# Altium schematic sheet 01_INPUT_POWER.SchDoc
size A3
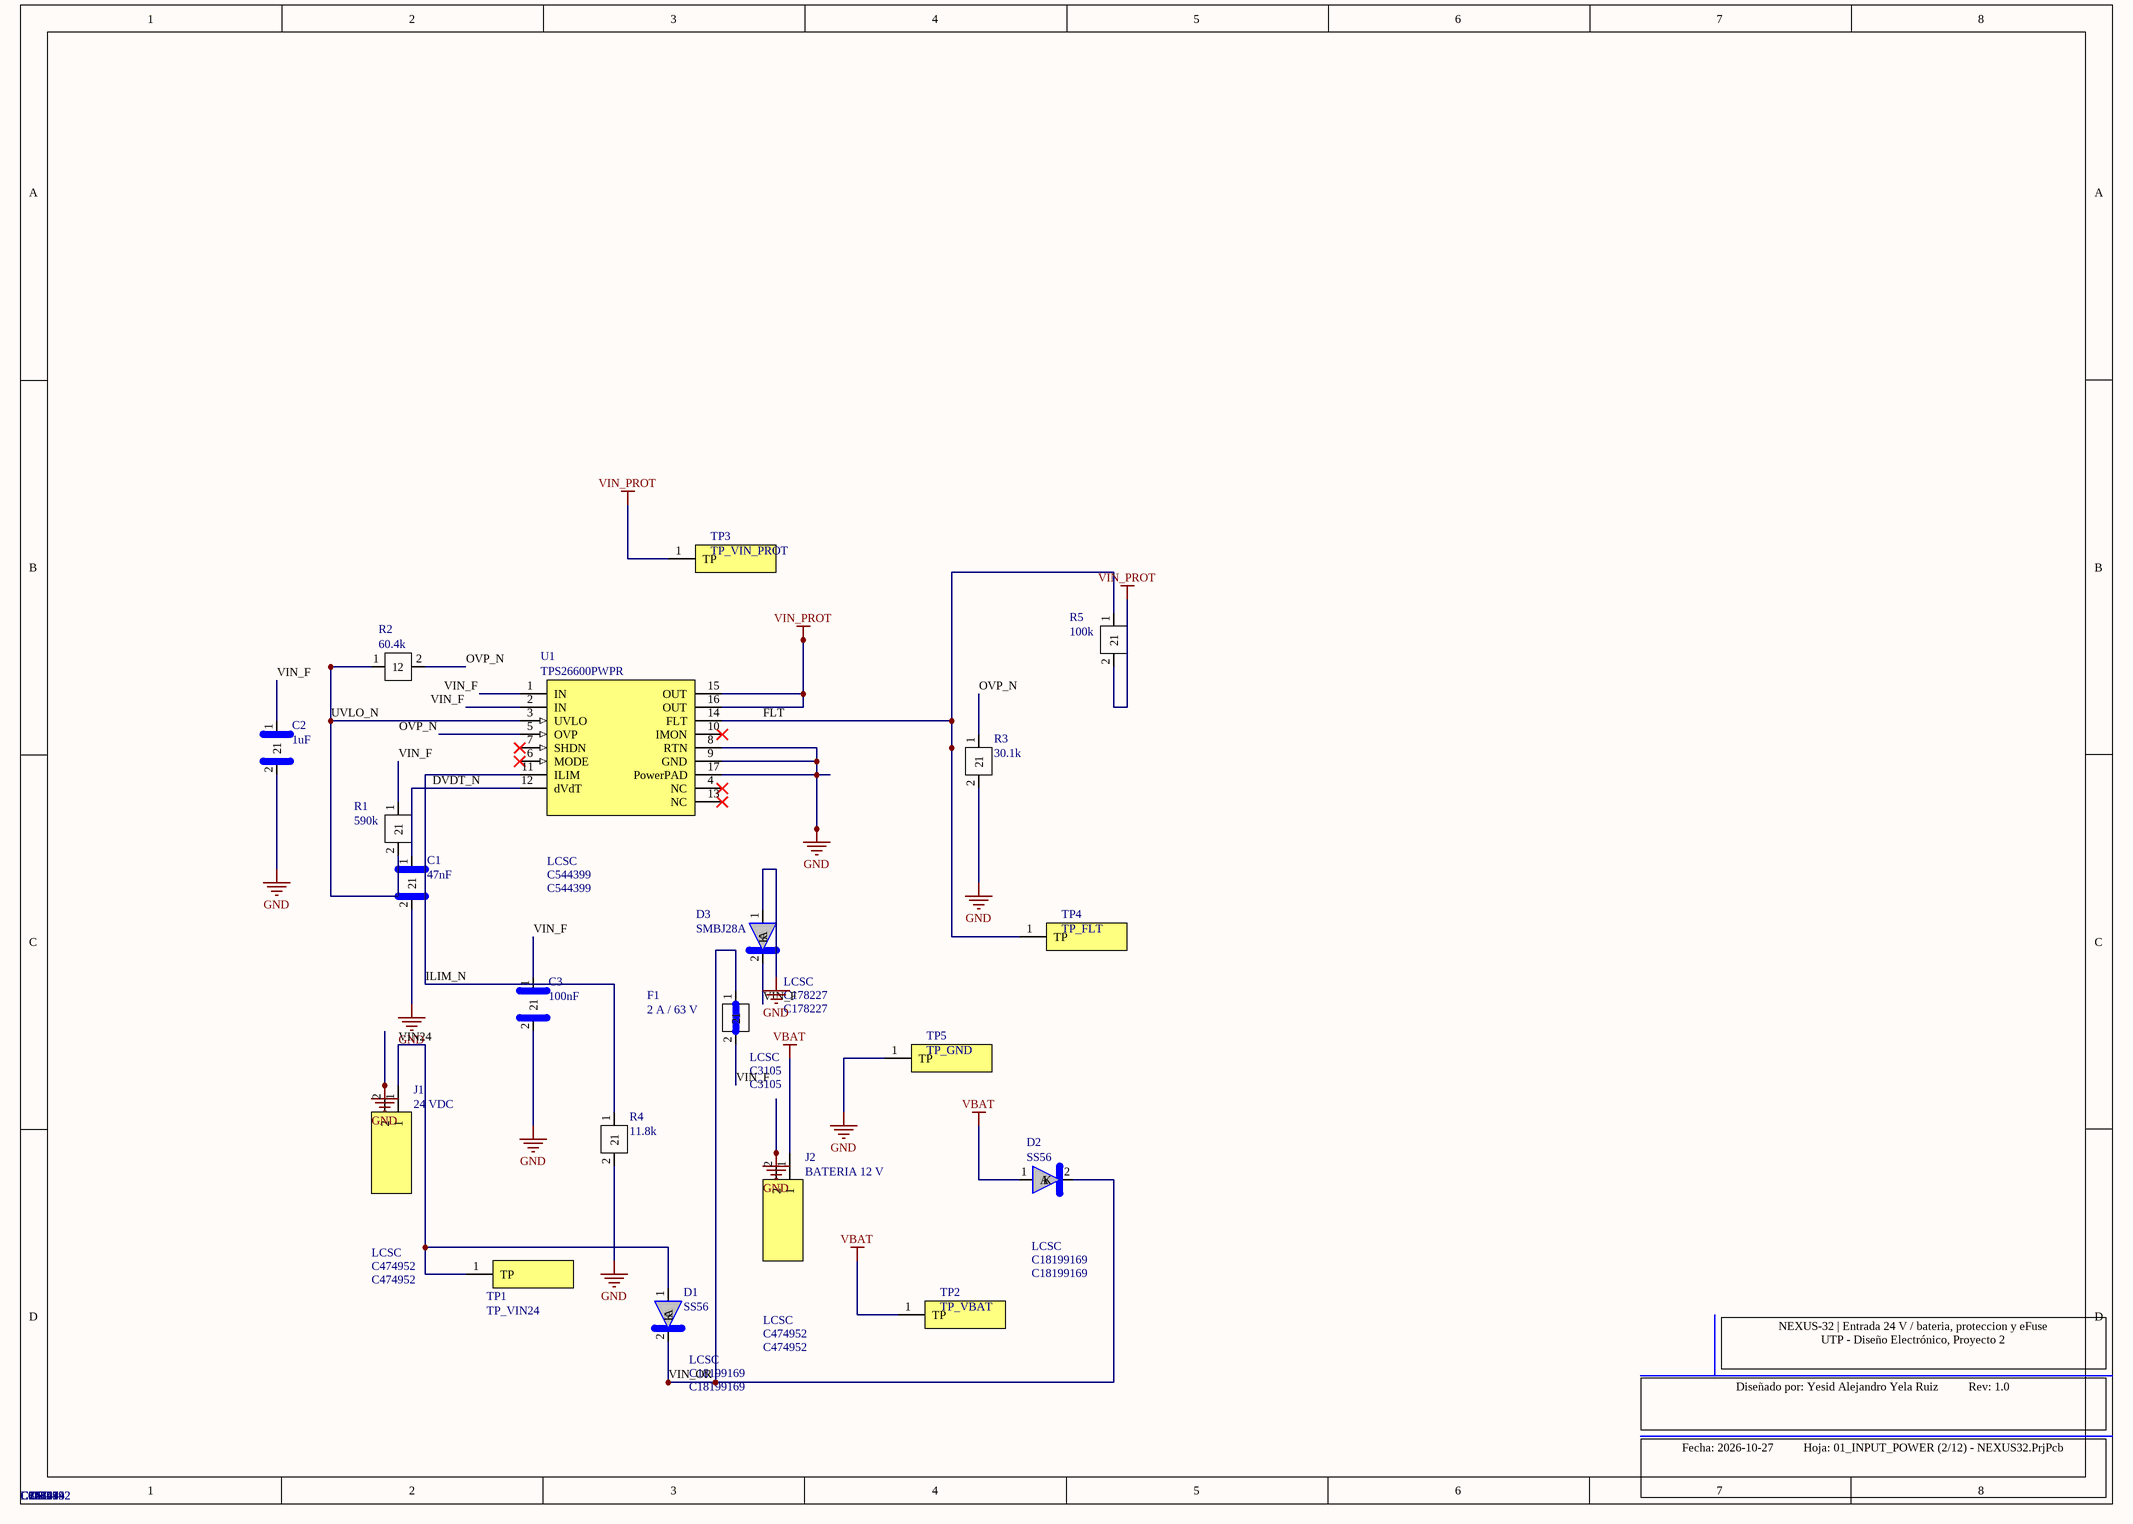
[diagram p0: 01_INPUT_POWER.SchDoc]

## Parts
C1  47nF  Supplier 1: LCSC  Supplier Part Number 1: C1622  [R_0603]
C2  1uF  Supplier 1: LCSC  Supplier Part Number 1: C15849  [R_0603]
C3  100nF  Supplier 1: LCSC  Supplier Part Number 1: C14663  [R_0603]
D1  SS56  Supplier 1: LCSC  Supplier Part Number 1: C18199169  [D_SMA]
D2  SS56  Supplier 1: LCSC  Supplier Part Number 1: C18199169  [D_SMA]
D3  SMBJ28A  Supplier 1: LCSC  Supplier Part Number 1: C178227  [D_SMB]
F1  2 A / 63 V  Supplier 1: LCSC  Supplier Part Number 1: C3105  [F_1206]
J1  24 VDC  Supplier 1: LCSC  Supplier Part Number 1: C474952  [TB_KF128-5.08-2P]
J2  BATERIA 12 V  Supplier 1: LCSC  Supplier Part Number 1: C474952  [TB_KF128-5.08-2P]
R1  590k  Supplier 1: LCSC  Supplier Part Number 1: C861479  [R_0603]
R2  60.4k  Supplier 1: LCSC  Supplier Part Number 1: C862235  [R_0603]
R3  30.1k  Supplier 1: LCSC  Supplier Part Number 1: C2989442  [R_0603]
R4  11.8k  Supplier 1: LCSC  Supplier Part Number 1: C22861  [R_0603]
R5  100k  Supplier 1: LCSC  Supplier Part Number 1: C25803  [R_0603]
TP1  TP_VIN24  [TP_PAD_1.5mm]
TP2  TP_VBAT  [TP_PAD_1.5mm]
TP3  TP_VIN_PROT  [TP_PAD_1.5mm]
TP4  TP_FLT  [TP_PAD_1.5mm]
TP5  TP_GND  [TP_PAD_1.5mm]
U1  TPS26600PWPR  Supplier 1: LCSC  Supplier Part Number 1: C544399  [HTSSOP-16-EP_PWP_P0.65]

## Nets
GND: C1.2 C2.2 C3.2 D3.1(A) J1.2 J2.2 R3.2 R4.2 TP5.1(TP) U1.8(RTN) U1.9(GND) U1.17(PowerPAD)
VBAT: D2.1(A) J2.1 TP2.1(TP)
VIN_PROT: R5.2 TP3.1(TP) U1.15(OUT) U1.16(OUT)
DVDT_N: C1.1 U1.12(dVdT)
FLT: R5.1 TP4.1(TP) U1.14(FLT)
ILIM_N: R4.1 U1.11(ILIM)
OVP_N: R2.2 R3.1 U1.5(OVP)
UVLO_N: R1.2 R2.1 U1.3(UVLO)
VIN24: D1.1(A) J1.1 TP1.1(TP)
VIN_F: C2.1 C3.1 D3.2(K) F1.2 R1.1 U1.1(IN) U1.2(IN)
VIN_OR: D1.2(K) D2.2(K) F1.1

Not connected (* = marked no-connect by the designer): U1 4(NC)* 6(MODE)* 7(SHDN)* 10(IMON)* 13(NC)*

## Notes on the sheet
- NEXUS-32 | Entrada 24 V / bateria, proteccion y eFuse
  UTP - Diseño Electrónico, Proyecto 2
- Diseñado por: Yesid Alejandro Yela Ruiz          Rev: 1.0
- Fecha: 2026-10-27          Hoja: 01_INPUT_POWER (2/12) - NEXUS32.PrjPcb

## Library data of the parts
C1 = CAP_0603: Condensador ceramico SMD 0603; Manufacturer: Samsung; Manufacturer Part Number: CL10B473KB8NNNC; Datasheet: https://wmsc.lcsc.com/wmsc/upload/file/pdf/v2/lcsc/2206010045_UNI-ROYAL-Uniroyal-Elec-0603WAF1002T5E_C25804.pdf; LCSC Part #: C1622
C2 = CAP_0603: Condensador ceramico SMD 0603; Manufacturer: Samsung; Manufacturer Part Number: CL10A105KB8NNNC; Datasheet: https://wmsc.lcsc.com/wmsc/upload/file/pdf/v2/lcsc/2206010045_UNI-ROYAL-Uniroyal-Elec-0603WAF1002T5E_C25804.pdf; LCSC Part #: C15849
C3 = CAP_0603: Condensador ceramico SMD 0603; Manufacturer: YAGEO; Manufacturer Part Number: CC0603KRX7R9BB104; Datasheet: https://wmsc.lcsc.com/wmsc/upload/file/pdf/v2/lcsc/2206010045_UNI-ROYAL-Uniroyal-Elec-0603WAF1002T5E_C25804.pdf; LCSC Part #: C14663
D1 D2 = SS56: Diodo Schottky 40V 5A SMA (MDD SS54); Manufacturer: hongjiacheng; Manufacturer Part Number: SS56; LCSC Part #: C18199169; Datasheet: https://wmsc.lcsc.com/wmsc/upload/file/pdf/v2/lcsc/2407101107_MDD-Microdiode-Semiconductor-SS54_C22452.pdf
D3 = SMBJ28A: TVS unidireccional 28V 600W SMB (Littelfuse SMBJ28A); Manufacturer: Littelfuse; Manufacturer Part Number: SMBJ28A; LCSC Part #: C178227; Datasheet: https://wmsc.lcsc.com/wmsc/upload/file/pdf/v2/lcsc/2304140030_Littelfuse-SMBJ28A_C178227.pdf
F1 = FUSE_1206: Fusible SMD 1206 2A 63V (Littelfuse 0466002.NRHF); Manufacturer: Littelfuse; Manufacturer Part Number: 0466002.NRHF; LCSC Part #: C3105; Datasheet: https://wmsc.lcsc.com/wmsc/upload/file/pdf/v2/lcsc/1810111920_Littelfuse-0466002-NRHF_C3105.pdf
J1 J2 = KF128-5.08-2P-AA: Bornera tornillo 2 polos paso 5.08mm (Cixi Kefa KF128-5.08-2P-AA); Manufacturer: Cixi Kefa Electronics (KEFA); Manufacturer Part Number: KF128-5.08-2P-AA; LCSC Part #: C474952; Datasheet: https://wmsc.lcsc.com/wmsc/upload/file/pdf/v2/lcsc/2408211511_Cixi-Kefa-Elec-KF128-5-08-2P-AA_C474952.pdf
R1 = RES_0603: Resistencia SMD 0603; Manufacturer: YAGEO; Manufacturer Part Number: RT0603BRD07590KL; Datasheet: https://wmsc.lcsc.com/wmsc/upload/file/pdf/v2/lcsc/2206010045_UNI-ROYAL-Uniroyal-Elec-0603WAF1002T5E_C25804.pdf; LCSC Part #: C861479
R2 = RES_0603: Resistencia SMD 0603; Manufacturer: YAGEO; Manufacturer Part Number: RT0603BRE0760K4L; Datasheet: https://wmsc.lcsc.com/wmsc/upload/file/pdf/v2/lcsc/2206010045_UNI-ROYAL-Uniroyal-Elec-0603WAF1002T5E_C25804.pdf; LCSC Part #: C862235
R3 = RES_0603: Resistencia SMD 0603; Manufacturer: UNI-ROYAL; Manufacturer Part Number: TC0325B3012T5F; Datasheet: https://wmsc.lcsc.com/wmsc/upload/file/pdf/v2/lcsc/2206010045_UNI-ROYAL-Uniroyal-Elec-0603WAF1002T5E_C25804.pdf; LCSC Part #: C2989442
R4 = RES_0603: Resistencia SMD 0603; Manufacturer: UNI-ROYAL; Manufacturer Part Number: 0603WAF1182T5E; Datasheet: https://wmsc.lcsc.com/wmsc/upload/file/pdf/v2/lcsc/2206010045_UNI-ROYAL-Uniroyal-Elec-0603WAF1002T5E_C25804.pdf; LCSC Part #: C22861
R5 = RES_0603: Resistencia SMD 0603; Manufacturer: UNI-ROYAL; Manufacturer Part Number: 0603WAF1003T5E; Datasheet: https://wmsc.lcsc.com/wmsc/upload/file/pdf/v2/lcsc/2206010045_UNI-ROYAL-Uniroyal-Elec-0603WAF1002T5E_C25804.pdf; LCSC Part #: C25803
TP1-TP5 = TESTPOINT: Punto de prueba, pad desnudo de 1.5mm sin montaje; Manufacturer: n/a; Manufacturer Part Number: TP_PAD_1.5mm; Datasheet: https://wmsc.lcsc.com/wmsc/upload/file/pdf/v2/lcsc/2206010045_UNI-ROYAL-Uniroyal-Elec-0603WAF1002T5E_C25804.pdf
U1 = TPS26600PWPR: eFuse 4.2-60V, OVP/UVLO ajustables, HTSSOP-16 PowerPAD (TI TPS26600PWPR); Manufacturer: Texas Instruments; Manufacturer Part Number: TPS26600PWPR; LCSC Part #: C544399; Datasheet: https://wmsc.lcsc.com/wmsc/upload/file/pdf/v2/lcsc/2007161516_Texas-Instruments-TPS26600PWPR_C544399.pdf